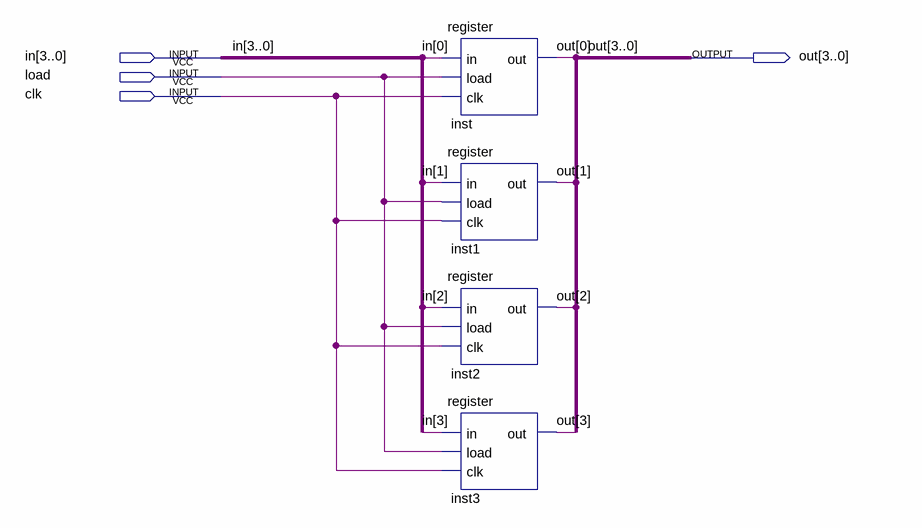
[diagram p0: schematic sheet]
// Quartus schematic registerw4.bdf as structural Verilog: 4 symbols, 4 pins
module registerw4 (
  input  [3:0] in,
  input  load,
  input  clk,
  output [3:0] out
);

  register inst (.in(in[0]), .load(load), .clk(clk), .out(out[0]));
  register inst1 (.in(in[1]), .load(load), .clk(clk), .out(out[1]));
  register inst2 (.in(in[2]), .load(load), .clk(clk), .out(out[2]));
  register inst3 (.in(in[3]), .load(load), .clk(clk), .out(out[3]));
endmodule
